# Altium schematic sheet 19_Radar_12V_to_3V3.SchDoc
size 289 x 401 mm
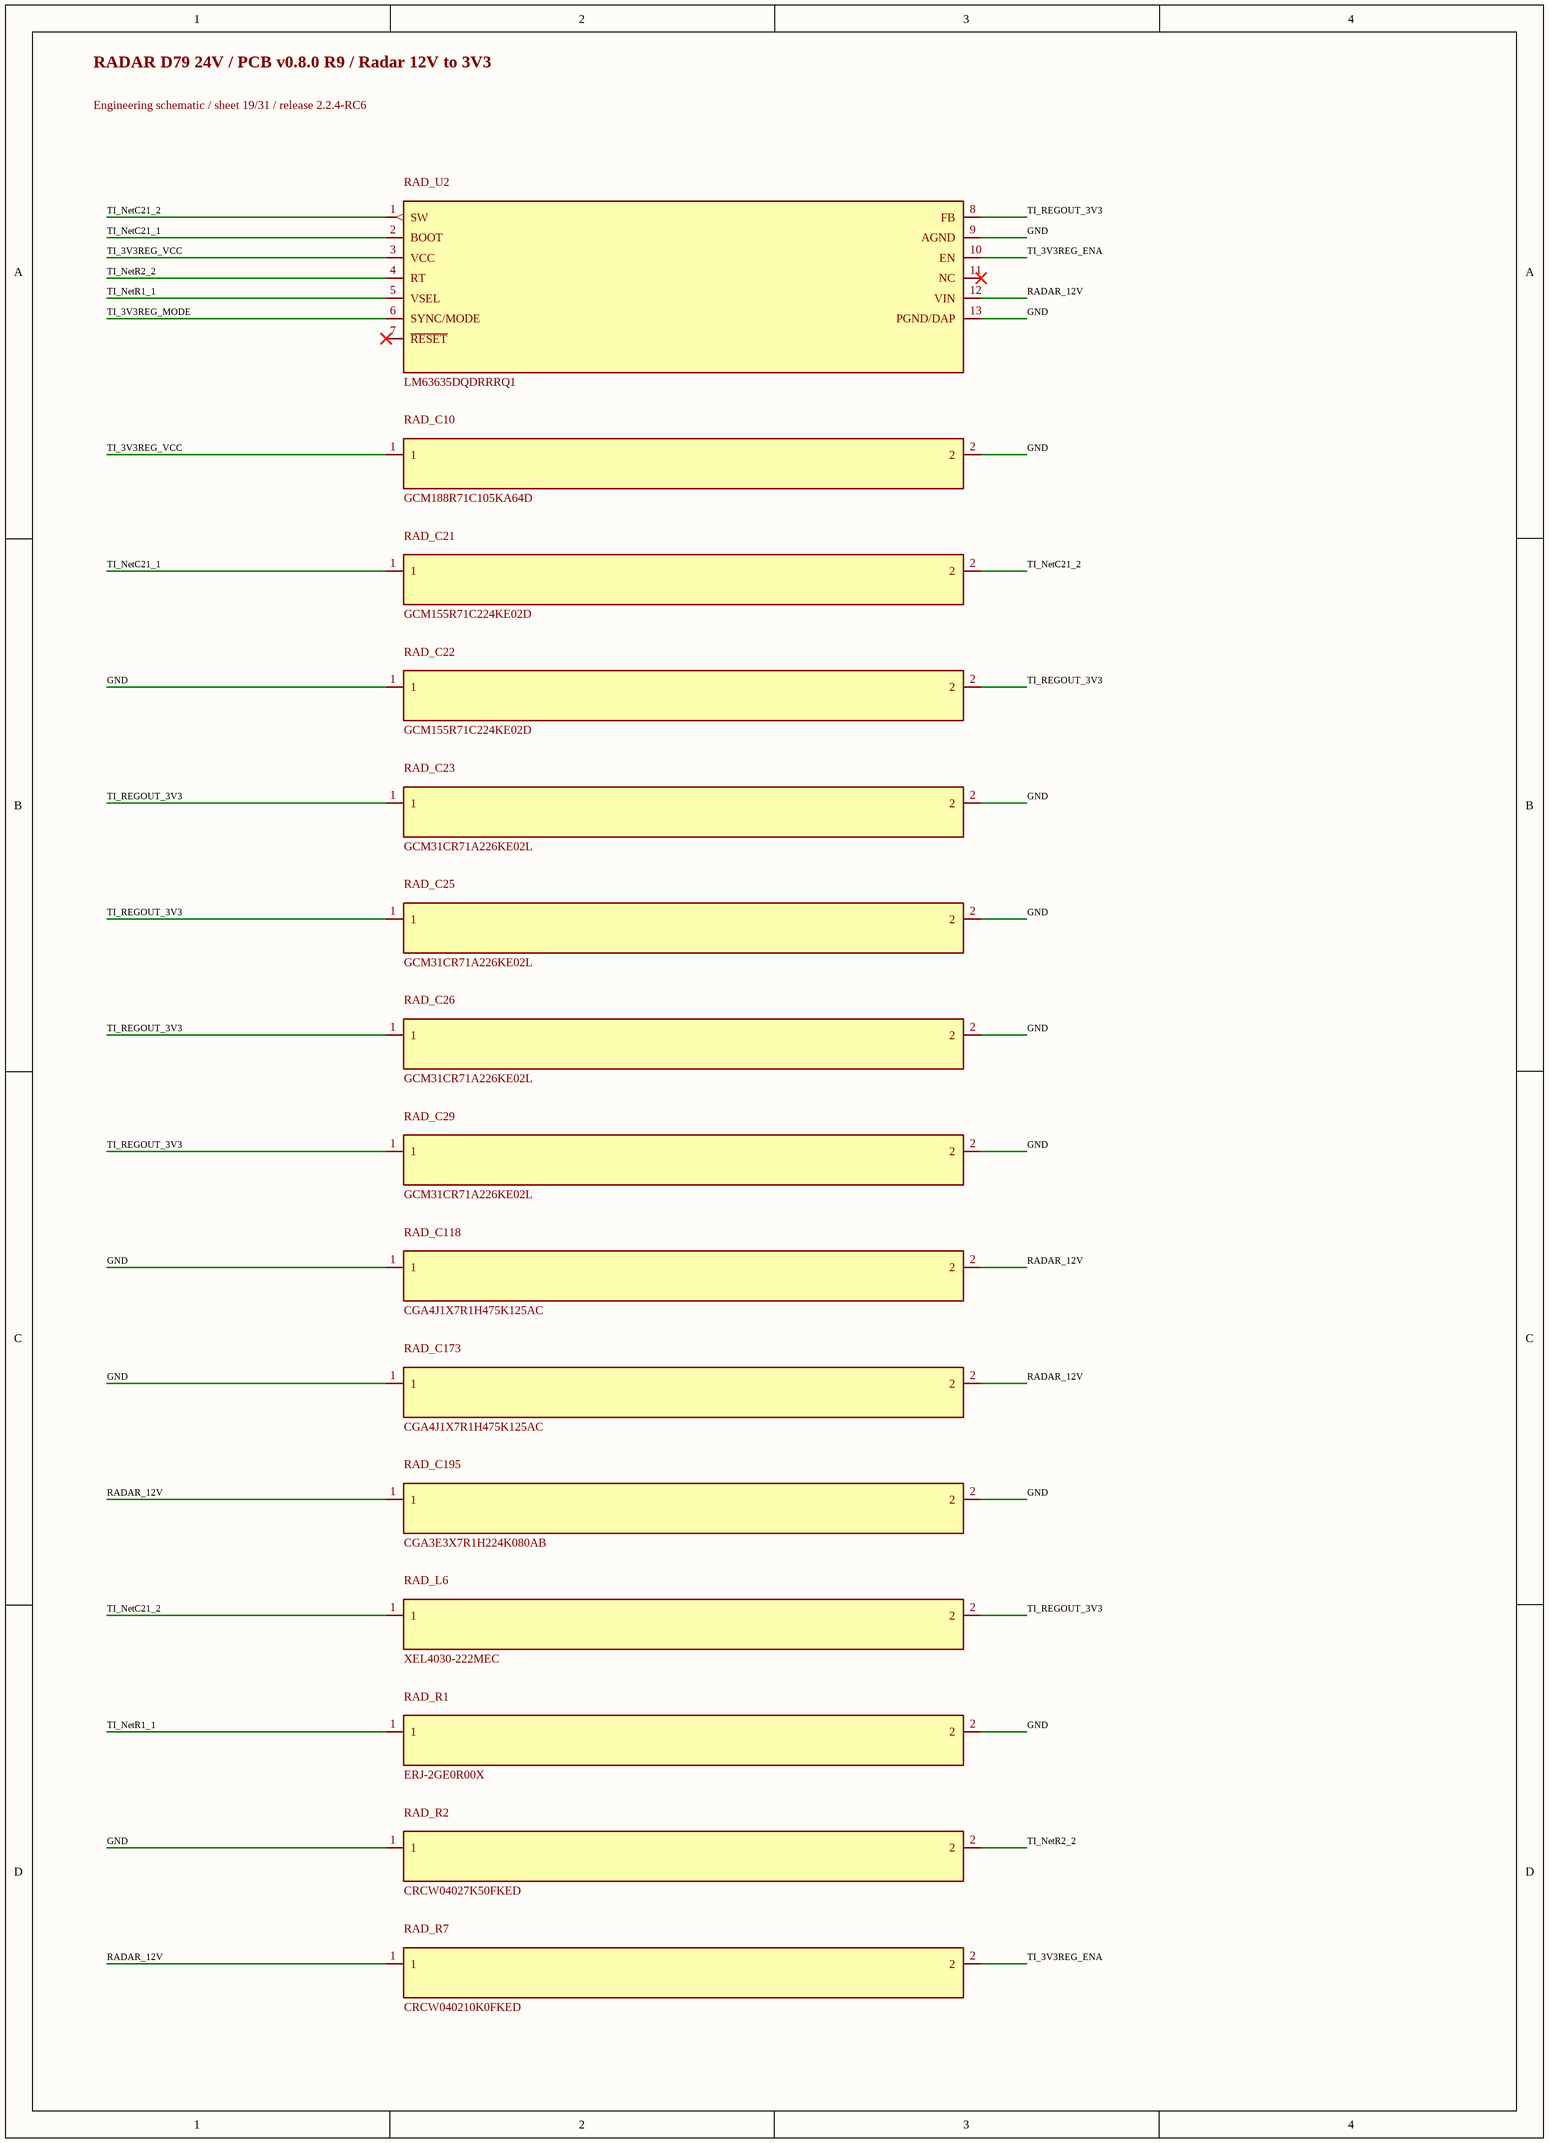
[diagram p0: 19_Radar_12V_to_3V3.SchDoc]

## Parts
RAD_C10  GCM188R71C105KA64D  [0603L]
RAD_C21  GCM155R71C224KE02D  [0402L]
RAD_C22  GCM155R71C224KE02D  [0402L]
RAD_C23  GCM31CR71A226KE02L  [1206_180L]
RAD_C25  GCM31CR71A226KE02L  [1206_180L]
RAD_C26  GCM31CR71A226KE02L  [1206_180L]
RAD_C29  GCM31CR71A226KE02L  [1206_180L]
RAD_C118  CGA4J1X7R1H475K125AC  [FP-CGA4J1X7R1H475K125AC_0805-MFG]
RAD_C173  CGA4J1X7R1H475K125AC  [FP-CGA4J1X7R1H475K125AC_0805-MFG]
RAD_C195  CGA3E3X7R1H224K080AB  [0603L]
RAD_L6  XEL4030-222MEC  [FP-XEL4030-222MEC_SMT2_4MM0_4MM0-MFG]
RAD_R1  ERJ-2GE0R00X  [0402L]
RAD_R2  CRCW04027K50FKED  [0402L]
RAD_R7  CRCW040210K0FKED  [0402L]
RAD_U2  LM63635DQDRRRQ1  [DRR0012E-MFG]

## Nets
GND: RAD_C10.2 RAD_C22.1 RAD_C23.2 RAD_C25.2 RAD_C26.2 RAD_C29.2 RAD_C118.1 RAD_C173.1 RAD_C195.2 RAD_R1.2 RAD_R2.1 RAD_U2.9(AGND) RAD_U2.13(PGND/DAP)
RADAR_12V: RAD_C118.2 RAD_C173.2 RAD_C195.1 RAD_R7.1 RAD_U2.12(VIN)
TI_3V3REG_ENA: RAD_R7.2 RAD_U2.10(EN)
TI_3V3REG_MODE: RAD_U2.6(SYNC/MODE)
TI_3V3REG_VCC: RAD_C10.1 RAD_U2.3(VCC)
TI_NetC21_1: RAD_C21.1 RAD_U2.2(BOOT)
TI_NetC21_2: RAD_C21.2 RAD_L6.1 RAD_U2.1(SW)
TI_NetR1_1: RAD_R1.1 RAD_U2.5(VSEL)
TI_NetR2_2: RAD_R2.2 RAD_U2.4(RT)
TI_REGOUT_3V3: RAD_C22.2 RAD_C23.1 RAD_C25.1 RAD_C26.1 RAD_C29.1 RAD_L6.2 RAD_U2.8(FB)

Not connected (* = marked no-connect by the designer): RAD_U2 7(~{RESET})* 11(NC)*

## Notes on the sheet
- RADAR D79 24V / PCB v0.8.0 R9 / Radar 12V to 3V3
- Engineering schematic / sheet 19/31 / release 2.2.4-RC6